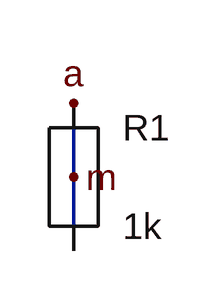
[diagram p0: schematic same_instance_label_inside.asc]
same_instance_label_inside.asc, the LTspice schematic file:
Version 4
SHEET 1 880 680
WIRE 96 96 96 192
FLAG 96 96 a
FLAG 96 144 m
SYMBOL res 96 144 R0
SYMATTR InstName R1
SYMATTR Value 1k

The netlist it stands for:
* same_instance_label_inside.asc
R1 m m 1k
.backanno
.end